# Altium schematic sheet Ethernet_and_SD_Card.SchDoc
size A4; SheetNumber: 3; SheetTotal: 13
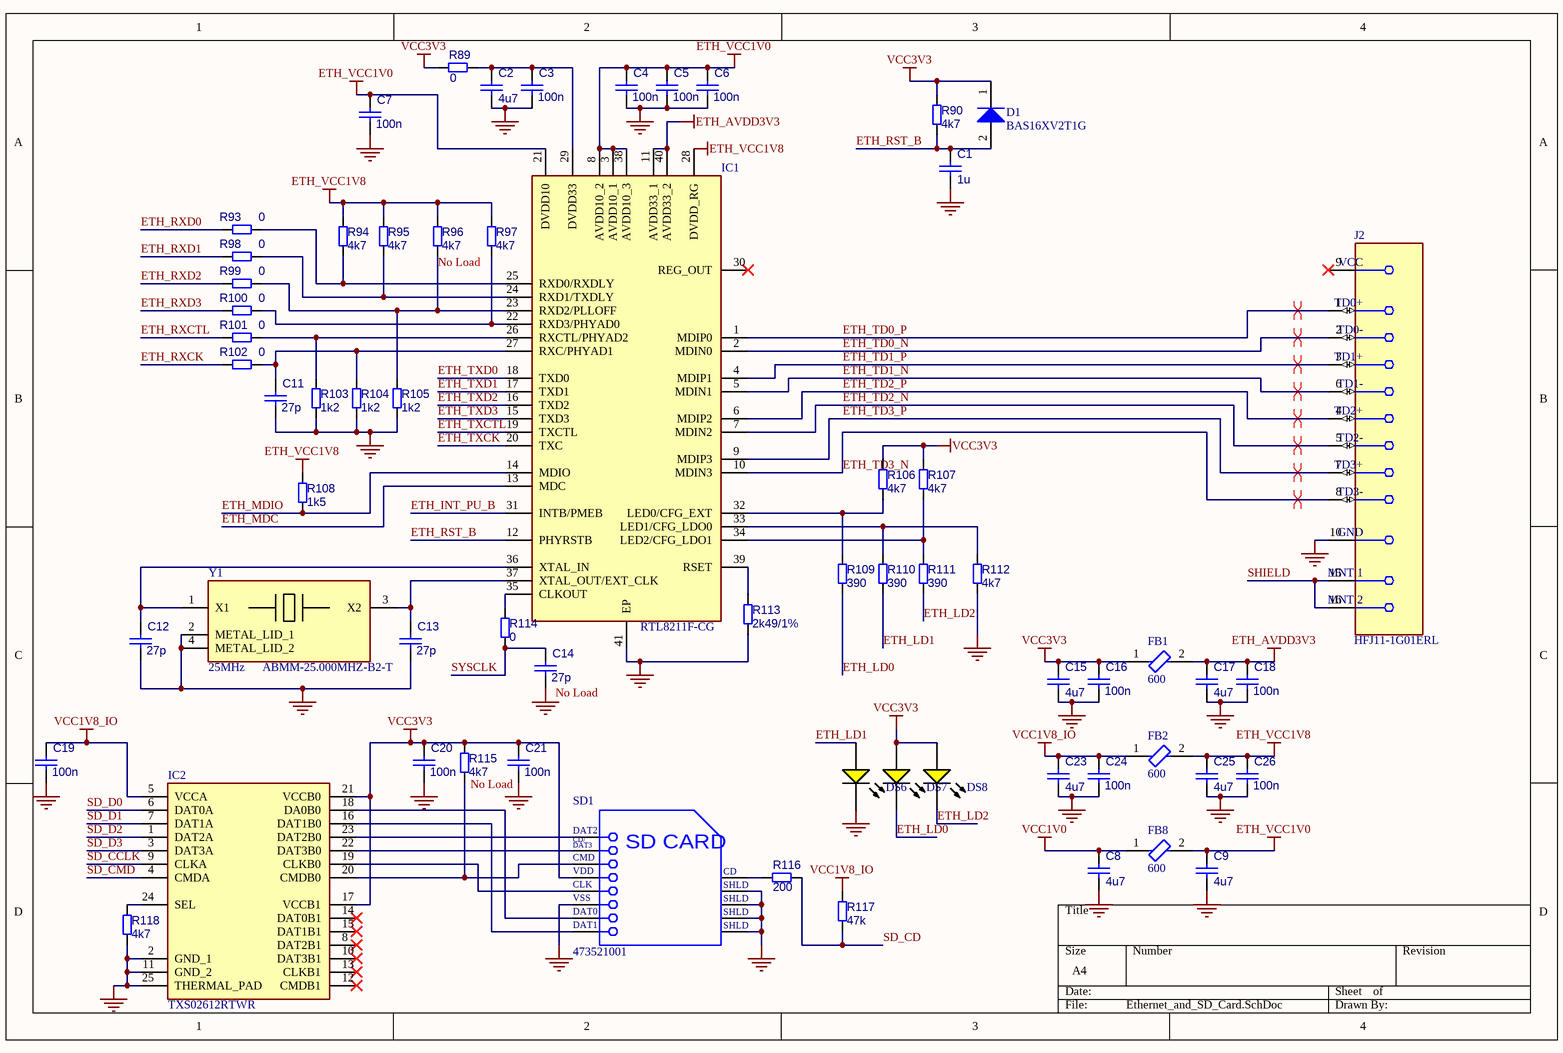
[diagram p0: Ethernet_and_SD_Card.SchDoc]

## Parts
C1  1u  [C_0805]
C2  4u7  [C_0805]
C3  100n  [CAPC1005X50N_0402]
C4  100n  [CAPC1005X50N_0402]
C5  100n  [CAPC1005X50N_0402]
C6  100n  [CAPC1005X50N_0402]
C7  100n  [CAPC1005X50N_0402]
C8  4u7  [C_0805]
C9  4u7  [C_0805]
C11  27p  [CAPC1005X50N_0402]
C12  27p  [CAPC1005X50N_0402]
C13  27p  [CAPC1005X50N_0402]
C14  27p  [CAPC1005X50N_0402]
C15  4u7  [C_0805]
C16  100n  [CAPC1005X50N_0402]
C17  4u7  [C_0805]
C18  100n  [CAPC1005X50N_0402]
C19  100n  [CAPC1005X50N_0402]
C20  100n  [CAPC1005X50N_0402]
C21  100n  [CAPC1005X50N_0402]
C23  4u7  [C_0805]
C24  100n  [CAPC1005X50N_0402]
C25  4u7  [C_0805]
C26  100n  [CAPC1005X50N_0402]
D1  BAS16XV2T1G  [ONSC-SOD-523-2-502-01_V]
DS6  19-217/Y5C-AM1N1VY/3T  [EVRL-0603-2_V]  (value not drawn)
DS7  19-217/Y5C-AM1N1VY/3T  [EVRL-0603-2_V]  (value not drawn)
DS8  19-217/Y5C-AM1N1VY/3T  [EVRL-0603-2_V]  (value not drawn)
FB1  600  [FP-BLM31-0_2-t1_6-IPC_A]
FB2  600  [FP-BLM31-0_2-t1_6-IPC_A]
FB8  600  [FP-BLM31-0_2-t1_6-IPC_A]
IC1  RTL8211F-CG  [QFN40P500X500X90-41N-D]
IC2  TXS02612RTWR  [QFN50P400X400X80-25N-D]
J2  HFJ11-1G01ERL  [FP-HFJ11-1G01ERL-MFG]
R89  0  [R_0402]
R90  4k7  [R_0402]
R93  0  [R_0402]
R94  4k7  [R_0402]
R95  4k7  [R_0402]
R96  4k7  [R_0402]
R97  4k7  [R_0402]
R98  0  [R_0402]
R99  0  [R_0402]
R100  0  [R_0402]
R101  0  [R_0402]
R102  0  [R_0402]
R103  1k2  [R_0402]
R104  1k2  [R_0402]
R105  1k2  [R_0402]
R106  4k7  [R_0402]
R107  4k7  [R_0402]
R108  1k5  [R_0402]
R109  390  [R_0402]
R110  390  [R_0402]
R111  390  [R_0402]
R112  4k7  [R_0402]
R113  2k49/1%  [R_0402]
R114  0  [R_0402]
R115  4k7  [R_0402]
R116  200  [R_0402]
R117  47k  [R_0402]
R118  4k7  [R_0402]
SD1  473521001  [MOLX-473521001_V]
Y1  25MHz  [ABMM25000MHZB2T]

## Nets
ETH_AVDD3V3: C17.2 C18.2 FB1.2 IC1.11(AVDD33_1) IC1.40(AVDD33_2)
ETH_VCC1V0: C4.2 C5.2 C6.2 C7.2 C9.2 FB8.2 IC1.3(AVDD10_1) IC1.8(AVDD10_2) IC1.21(DVDD10) IC1.38(AVDD10_3)
ETH_VCC1V8: C25.2 C26.2 FB2.2 IC1.28(DVDD_RG) R94.2 R95.2 R96.2 R97.2 R108.2
GND: C1.1 C2.1 C3.1 C4.1 C5.1 C6.1 C7.1 C8.1 C9.1 C11.1 C12.1 C13.1 C14.1 C15.1 C16.1 C17.1 C18.1 C19.1 C20.1 C21.1 C23.1 C24.1 C25.1 C26.1 DS6.2(K) IC1.41(EP) IC2.2(GND_1) IC2.11(GND_2) IC2.25(THERMAL_PAD) J2.10(GND) R103.1 R104.1 R105.1 R112.2 R113.2 R118.1 SD1.6(VSS) SD1.10(SHLD) SD1.11(SHLD) SD1.12(SHLD) SD1.13(SHLD) Y1.2(METAL_LID_1) Y1.4(METAL_LID_2)
VCC1V0: C8.2 FB8.1
VCC1V8_IO: C19.2 C23.2 C24.2 FB2.1 IC2.5(VCCA) R117.2
VCC3V3: C15.2 C16.2 C20.2 C21.2 D1.1(K) DS7.1(A) DS8.1(A) FB1.1 IC2.17(VCCB1) IC2.21(VCCB0) R89.1 R90.2 R106.1 R107.1 R115.1 SD1.4(VDD)
ETH_INT_PU_B: IC1.31(INTB/PMEB)
ETH_LD0: DS7.2(K) R109.2
ETH_LD1: DS6.1(A) R110.2
ETH_LD2: DS8.2(K) R111.2
ETH_MDC: IC1.13(MDC)
ETH_MDIO: IC1.14(MDIO) R108.1
ETH_RST_B: C1.2 D1.2(A) IC1.12(PHYRSTB) R90.1
ETH_RXCK: R102.1
ETH_RXCTL: R101.1
ETH_RXD0: R93.1
ETH_RXD1: R98.1
ETH_RXD2: R99.1
ETH_RXD3: R100.1
ETH_TD0_N: IC1.2(MDIN0) J2.2(TD0-)
ETH_TD0_P: IC1.1(MDIP0) J2.1(TD0+)
ETH_TD1_N: IC1.5(MDIN1) J2.6(TD1-)
ETH_TD1_P: IC1.4(MDIP1) J2.3(TD1+)
ETH_TD2_N: IC1.7(MDIN2) J2.5(TD2-)
ETH_TD2_P: IC1.6(MDIP2) J2.4(TD2+)
ETH_TD3_N: IC1.10(MDIN3) J2.8(TD3-)
ETH_TD3_P: IC1.9(MDIP3) J2.7(TD3+)
ETH_TXCK: IC1.20(TXC)
ETH_TXCTL: IC1.19(TXCTL)
ETH_TXD0: IC1.18(TXD0)
ETH_TXD1: IC1.17(TXD1)
ETH_TXD2: IC1.16(TXD2)
ETH_TXD3: IC1.15(TXD3)
SD_CCLK: IC2.9(CLKA)
SD_CD: R116.2 R117.1
SD_CMD: IC2.4(CMDA)
SD_D0: IC2.6(DAT0A)
SD_D1: IC2.7(DAT1A)
SD_D2: IC2.1(DAT2A)
SD_D3: IC2.3(DAT3A)
SHIELD: J2.15(MNT_1) J2.16(MNT_2)
SYSCLK: C14.2 R114.2
NetC2_2: C2.2 C3.2 IC1.29(DVDD33) R89.2
NetC11_2: C11.2 IC1.27(RXC/PHYAD1) R102.2 R104.2
NetC12_2: C12.2 IC1.36(XTAL_IN) Y1.1(X1)
NetC13_2: C13.2 IC1.37(XTAL_OUT/EXT_CLK) Y1.3(X2)
NetIC1_22: IC1.22(RXD3/PHYAD0) R97.1 R100.2
NetIC1_23: IC1.23(RXD2/PLLOFF) R96.1 R99.2 R105.2
NetIC1_24: IC1.24(RXD1/TXDLY) R95.1 R98.2
NetIC1_25: IC1.25(RXD0/RXDLY) R93.2 R94.1
NetIC1_26: IC1.26(RXCTL/PHYAD2) R101.2 R103.2
NetIC1_32: IC1.32(LED0/CFG_EXT) R106.2 R109.1
NetIC1_33: IC1.33(LED1/CFG_LDO0) R110.1 R112.1
NetIC1_34: IC1.34(LED2/CFG_LDO1) R107.2 R111.1
NetIC1_35: IC1.35(CLKOUT) R114.1
NetIC1_39: IC1.39(RSET) R113.1
NetIC2_16: IC2.16(DAT1B0) SD1.8(DAT1)
NetIC2_18: IC2.18(DA0B0) SD1.7(DAT0)
NetIC2_19: IC2.19(CLKB0) SD1.5(CLK)
NetIC2_20: IC2.20(CMDB0) R115.2 SD1.3(CMD)
NetIC2_22: IC2.22(DAT3B0) SD1.2(CD/DAT3)
NetIC2_23: IC2.23(DAT2B0) SD1.1(DAT2)
NetIC2_24: IC2.24(SEL) R118.2
NetR116_1: R116.1 SD1.9(CD)

Not connected (* = marked no-connect by the designer): IC1 30(REG_OUT)*; IC2 8(DAT2B1)* 10(DAT3B1)* 12(CMDB1)* 13(CLKB1)* 14(DAT0B1)* 15(DAT1B1)*; J2 9(VCC)*

## Layout directives
differential pair: ETH_TD0_N, ETH_TD0_P, ETH_TD1_N, ETH_TD1_P, ETH_TD2_N, ETH_TD2_P, ETH_TD3_N, ETH_TD3_P

## Notes on the sheet
- No Load
- (near Y1) ABMM-25.000MHZ-B2-T
- (near C14) No Load
- (in symbol CMP-2000-05848-1) CD/; DAT3; SD CARD

## Library data of the parts
C1 C2 C8 C9 C15 C17 C23 C25 = CMP-001-00086-2: MLCC 0805
C3-C7 C11-C14 C16 C18-C21 C24 C26 = CMP-001-00084-2: MLCC 0402
D1 = CMP-1054-00076-1: Switching Diode, 2-Pin SOD-523, Pb-Free, Tape and Reel; Manufacturer: On Semiconductor; trr Max (ns): 6; Configuration: Single; IF Max (A): 0.2; ComponentLink1URL: http://www.onsemi.com/; DatasheetVersion: Rev. 7; RoHS: TRUE; PackageVersion: Rev. E, 09/2010; Packing: Tape and Reel; ComponentLink2Description: Datasheet; ComponentLink2URL: http://www.onsemi.com/pub_link/Collateral/BAS16XV2T1-D.PDF; ComponentLink3Description: Package Specification; PackageReference: SOD-523-2-502-01; ComponentLink1Description: Manufacturer URL; PartNumber: BAS16XV2T1G; Mounting Technology: Surface Mount; PackageDescription: 2-Pin SOD, Body 1.2 x 0.8 mm; ComponentLink3URL: http://www.onsemi.com/pub_link/Collateral/502-01.PDF
DS6-DS8 = CMP-007-00005-2: Chip LED, Yellow, 5 V, 25mA, -40 to 85 degC, 2-Pin SMD (0603), RoHS, Tape and Reel; Manufacturer: Everlight Electronics; Datasheet Version: Rev. 1.0, 12/2005; Package Reference: 0603; Mounting Technology: SM; Package Description: 2-Pin Surface Mount Device, Body 1.6 x 0.8 mm; Case/Package: 0603; Datasheet URL: http://www.fairchip.com/pdf/Everlight/19-217-Y5C-AM1N1VY-3T.pdf; Manufacturer URL: http://www.everlight.com/; RoHS Compliant: False
FB1 FB2 FB8 = CMP-06046-002432-1: Chip Ferrite Bead, 1206, 600Ω @ 100MHz, 0.038Ω, 25%, 2.9A; Number of Lines: 1; DC Resistance (DCR): 38mR; Max Operating Temperature: 125°C; Packaging: Cut Tape; Min Operating Temperature: -55°C; Mount: Surface Mount; Case Code (Metric): 3216; Case/Package: 1206; Case Code (Imperial): 1206; Max Current Rating: 2.9A
IC1 = RTL8211F-CG: Integrated Circuit; Manufacturer_Name: Realtek; Height: 0.9mm; Manufacturer_Part_Number: RTL8211F-CG
IC2 = TXS02612RTWR: Integrated Circuit; Manufacturer_Name: Texas Instruments; Datasheet Link: http://www.ti.com/lit/gpn/txs02612; Height: 0.8mm; Manufacturer_Part_Number: TXS02612RTWR; Mouser Part Number: 595-TXS02612RTWR; Mouser Price/Stock: https://www.mouser.co.uk/ProductDetail/Texas-Instruments/TXS02612RTWR?qs=dqESbKqT1jaNFKC1R4M7hw%3D%3D; Arrow Part Number: TXS02612RTWR; Arrow Price/Stock: https://www.arrow.com/en/products/txs02612rtwr/texas-instruments?utm_currency=USD&region=nac
J2 = CMP-218039-000001-2: Conn RJ-45 F 8 POS 2.54mm Solder RA Thru-Hole 10 Terminal 1 Port; Manufacturer: HALO; Pitch: 1.27mm; Number Of Contacts: 8; Shielding: true; Conn Orientation: Horizontal; Conn Gender: Female; Is Female: yes; Manufacturer Part Number: HFJ11-1G01ERL; Device Class L1: Connectors; Device Class L2: Modular / Ethernet Connectors; Category: Conn; Automotive: No; ComponentLink2Description: Datasheet; Device Class L3: unset; Lead Free: Yes; Temperature Range Low: 0°C; Mouser Description: Conn RJ-45 F 8 POS 2.54mm Solder RA Thru-Hole 10 Terminal 1 Port; Temperature: 0°C to +70°C; Temperature Range High: +70°C; Package: 0; Contact Material: Gold; Height: 0.624inch; ComponentLink2URL: https://www.haloelectronics.com/pdf/fastjack-gigabit.pdf; Octopart: https://octopart.com/hfj11-1g01erl-halo-4052130; RoHS: TRUE
R89 R90 R93-R118 = CMP-009-00178-3: Chip 0402 resistor
SD1 = CMP-2000-05848-1: MicroSD(TM), Pitch 1.1 mm, 8 Position, Height 1.88 mm, -20 to 85 degC, RoHS, Tape and Reel; Manufacturer: Molex; Datasheet Version: Rev. G, 01/2012; Datasheet URL: http://www.molex.com/pdm_docs/sd/473521001_sd.pdf; Package Reference: 473521001; Manufacturer URL: http://www.molex.com/; Mounting Technology: SurfaceMount; Package Description: MicroSD(TM), Pitch 1.1 mm, 8 Position, Height 1.88 mm
Y1 = ABMM-25.000MHZ-B2-T: Crystal or Oscillator; Manufacturer_Name: ABRACON; Datasheet Link: https://abracon.com/Resonators/ABMM.pdf; Height: 1.2mm; Manufacturer_Part_Number: ABMM-25.000MHZ-B2-T; Mouser Part Number: 815-ABMM-25-B2-T; Mouser Price/Stock: https://www.mouser.co.uk/ProductDetail/ABRACON/ABMM-25.000MHZ-B2-T?qs=aMAwYrhw3fjtGmDmGUYkhw%3D%3D; Arrow Part Number: ABMM-25.000MHZ-B2-T; Arrow Price/Stock: https://www.arrow.com/en/products/abmm-25.000mhz-b2-t/abracon?utm_currency=USD&region=nac